# Altium schematic sheet Top_Sheet.SchDoc
size 420 x 297 mm; SheetNumber: 1; SheetTotal: 4
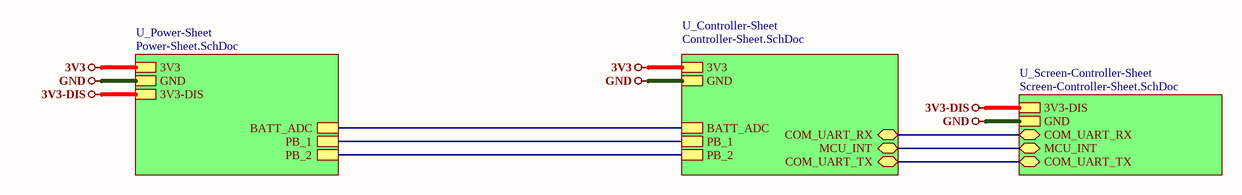
[diagram p0: Top_Sheet.SchDoc]

## Sub-sheets
U_Controller-Sheet = Controller-Sheet.SchDoc: 3V3, GND, BATT_ADC, PB_1, PB_2, COM_UART_RX (bidir), MCU_INT (bidir), COM_UART_TX (bidir)
U_Power-Sheet = Power-Sheet.SchDoc: 3V3, GND, BATT_ADC, PB_1, PB_2, 3V3-DIS
U_Screen-Controller-Sheet = Screen-Controller-Sheet.SchDoc: 3V3-DIS, GND, COM_UART_RX (bidir), MCU_INT (bidir), COM_UART_TX (bidir)

## Nets
3V3: sheet U_Controller-Sheet/3V3, sheet U_Power-Sheet/3V3
3V3-DIS: sheet U_Power-Sheet/3V3-DIS, sheet U_Screen-Controller-Sheet/3V3-DIS
GND: sheet U_Controller-Sheet/GND, sheet U_Power-Sheet/GND, sheet U_Screen-Controller-Sheet/GND
(unnamed): sheet U_Controller-Sheet/BATT_ADC, sheet U_Power-Sheet/BATT_ADC
(unnamed): sheet U_Controller-Sheet/PB_1, sheet U_Power-Sheet/PB_1
(unnamed): sheet U_Controller-Sheet/PB_2, sheet U_Power-Sheet/PB_2
(unnamed): sheet U_Controller-Sheet/COM_UART_RX, sheet U_Screen-Controller-Sheet/COM_UART_RX
(unnamed): sheet U_Controller-Sheet/MCU_INT, sheet U_Screen-Controller-Sheet/MCU_INT
(unnamed): sheet U_Controller-Sheet/COM_UART_TX, sheet U_Screen-Controller-Sheet/COM_UART_TX

## Notes on the sheet
- File:
- Title:
- Date:
- Page
- Num:
- Total:
- Drawn By: Huzaifa Ali